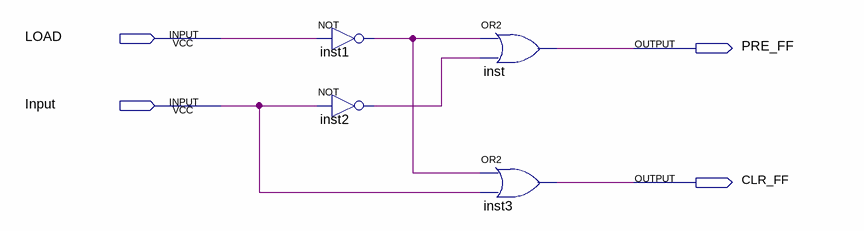
[diagram p0: schematic sheet]
// Quartus schematic Load_Circuit.bdf as structural Verilog: 4 symbols, 4 pins
module Load_Circuit (
  input  LOAD,
  input  Input,
  output PRE_FF,
  output CLR_FF
);

  wire inst1_out, inst2_out;

  not inst1 (inst1_out, LOAD);
  not inst2 (inst2_out, Input);
  or inst (PRE_FF, inst1_out, inst2_out);
  or inst3 (CLR_FF, inst1_out, Input);
endmodule
